# Altium project LNA_pcb.PrjPcb
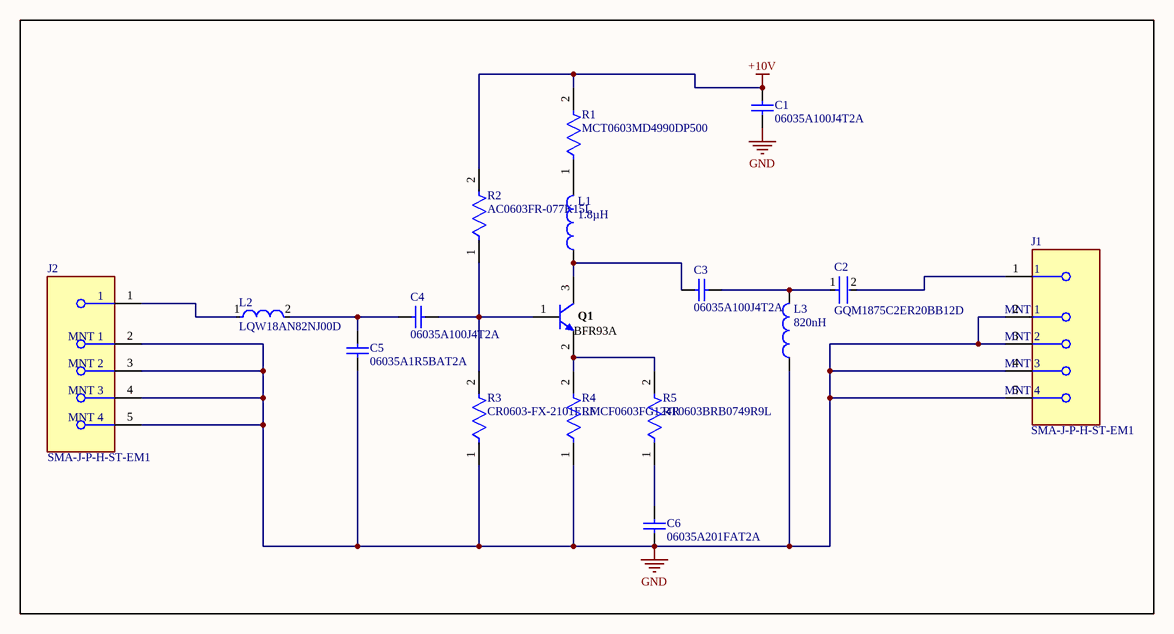
[diagram p0: LNA_sch.SchDoc]
1 sheet, 17 parts. Net scope: global (net labels, ports and power ports of the same name join across sheets).
Board file: pcb_lna.PcbDoc

## Sheet LNA_sch.SchDoc
size A4; SheetNumber: 1; SheetTotal: 1

### Parts
C1  06035A100J4T2A  [CAPC1608X90X35LL15T15]
C2  GQM1875C2ER20BB12D  [FP-GQM187-0_15-IPC_C]
C3  06035A100J4T2A  [CAPC1608X90X35LL15T15]
C4  06035A100J4T2A  [CAPC1608X90X35LL15T15]
C5  06035A1R5BAT2A  [CAPC1608X90X35NL15T15]
C6  06035A201FAT2A  [CAPC1608X90X35LL15T15]
J1  SMA-J-P-H-ST-EM1  [FP-SMA-J-P-H-ST-EM1-MFG]
J2  SMA-J-P-H-ST-EM1  [FP-SMA-J-P-H-ST-EM1-MFG]
L1  value 1.8µH  [INDC2012X60N]  (hidden comment: 0805L)
L2  LQW18AN82NJ00D  [FP-LQW18AN_00-MFG]
L3  value 820nH  [INDC1608X60N]  (hidden comment: 0603_820nL)
Q1  BFR93A  [INF-SOT23_N]
R1  MCT0603MD4990DP500  [FP-MCT0603-IPC_B]
R2  AC0603FR-077K15L  [FP-AC0603-MFG]
R3  CR0603-FX-2101ELF  [FP-CR0603-IPC_C]
R4  RMCF0603FG124R  [FP-RMCF0603-IPC_A]
R5  RT0603BRB0749R9L  [FP-RT0603-MFG]

### Nets
+10V: C1.2 R1.2 R2.2
GND: C1.1 C5.1 C6.1 J1.2(MNT_1) J1.3(MNT_2) J1.4(MNT_3) J1.5(MNT_4) J2.2(MNT_1) J2.3(MNT_2) J2.4(MNT_3) J2.5(MNT_4) L3.1 R3.1 R4.1
NetC2_1: C2.1 C3.1 L3.2
NetC2_2: C2.2 J1.1
NetC3_2: C3.2 L1.1 Q1.3(C)
NetC4_1: C4.1 C5.2 L2.2
NetC4_2: C4.2 Q1.1(B) R2.1 R3.2
NetC6_2: C6.2 R5.1
NetJ2_1: J2.1 L2.1
NetL1_2: L1.2 R1.1
NetQ1_2: Q1.2(E) R4.2 R5.2

### Library data of the parts
C1 C3 C4 = CMP-2006-04574-1: Manufacturer: AVX Interconnect / Elco; Part Number: 06035A100J4T2A
C2 = CMP-06035-025553-1: Ceramic Capacitor 0.2pF ±0.1pF 250VDC C0G 0603 Paper T/R; Voltage Rating: 250V; Max Operating Temperature: 125°C; Package Quantity: 4000; Case Code (Imperial): 0603; Capacitance: 0.2pF; Packaging: Tape and Reel; Length: 1.6mm; Width: 0.031inch; Dielectric: C0G; Mount: Surface Mount; Radiation Hardening: No; Depth: 0.8mm; Min Operating Temperature: -55°C; Case Code (Metric): 1608; Height: 0.7mm; Voltage Rating (DC): 250V; Termination: SMD/SMT; Thickness: 0.031inch; Case/Package: 0603
C5 = CMP-2006-04261-1: Manufacturer: AVX Interconnect / Elco; Part Number: 06035A1R5BAT2A
C6 = CMP-2006-04266-1: Manufacturer: AVX Interconnect / Elco; Part Number: 06035A201FAT2A
J1 J2 = CMP-02754-000006-1: CONN SMA JACK STR 50OHM EDGE MNT; Dielectric Material: PTFE; Center Contact Plating: Gold; Max Frequency: 6GHz; Body Material: Brass; Voltage Rating: 335V; Impedance: 50R; Package Quantity: 1; Case/Package: SMA; Max Operating Temperature: 125°C; Fastening Type: Threaded; Orientation: Straight; Depth: 13.33mm; RoHS Compliant: Yes; Length: 6.35mm; Insulation Material: Polytetrafluoroethylene; Termination: Solder; Min Operating Temperature: -65°C; Housing Color: Gold; Contact Plating: Gold; Contact Material: Copper; Connector Type: SMA; Mount: Edge; Series: SMA; Packaging: Tray; Body Plating: Gold; Radiation Hardening: No
L1 = CMP-006-00021-1: Surface mount 1.8 uH inductor in 0805 package
L2 = CMP-06042-002805-1: Wire Wound RF Inductor 82nH ±5% 250mA 0.6Ω 0603 (1608); Shielding: Unshielded; Test Frequency: 100MHz; DC Resistance (DCR): 600mR; Q Factor: 34; Current: 160mA; Self Resonant Frequency: 2GHz; Core Material: Non-Magnetic; Package Quantity: 4000; Min Operating Temperature: -55°C; Tolerance: 5%; Resistor Type: Wirewound; Case Code (Metric): 1608; Max Operating Temperature: 125°C; Mount: Surface Mount; Height - Seated (Max): 0.039inch; Height: 0.8mm; Termination: SMD/SMT; Military Standard: Not; Lead Free: Lead Free; Case Code (Imperial): 0603; Packaging: Tape and Reel; Current Rating: 250mA; Radiation Hardening: No; Width: 0.031inch; Max DC Current: 250mA; Case/Package: 0603; Weight: 0.000106oz; Inductance: 82nH; Length: 1.6mm; DC Current: 250mA; Depth: 1mm
L3 = CMP-006-00022-1: Surface mount 820nH inductor in 0603 package
Q1 = CMP-1189-00004-1: NPN Silicon RF Transistor, 12 V VCEO, 90 mA IC, 14.5 dB Gmax, SOT23, Green; Manufacturer: Infineon; Ptot (max): 300.0mW; VCEO (max): 12 V; Green: yes; Gmax (typ): 14.5 dB; IC (max): 90 mA; NFmin (typ): 1.5 dB; Group: For low frequencies, e.g. VHF/UHF; Mounting Technology: Surface Mount; PartNumber: BFR93A; ComponentLink3Description: Package Specification; ComponentLink2URL: http://www.infineon.com/dgdl/bfr93a.pdf?folderId=db3a30431400ef68011425b1354605c1&fileId=db3a30431400ef6801142702189806ae&location=en.Products.RF.RF_Transistors_.High_Linearity_Si-_and_SiGe_C-Transistors_for_use_up_to_6_GHz.DATASHEET.bfr93a.pdf; DatasheetVersion: Aug-2012; ComponentLink3URL: http://www.infineon.com/dgdl/SOT23-Package_Overview.pdf?folderId=db3a30431936bc4b0119532290053c66&fileId=db3a30431936bc4b0119533468123c85; ComponentLink1URL: http://www.infineon.com/; PackageDescription: 3-Pin Small Outline Transistor Package, 1.3 x 2.9 mm Body, 0.95 mm Pitch; PackageReference: SOT23; ComponentLink2Description: Datasheet; ComponentLink1Description: Manufacturer URL
R1 = CMP-02407-004071-1: RES SMD 100 OHM 1% 1/8W 0603; Voltage Rating: 75V; Max Power Dissipation: 150mW; Temperature Coefficient: 25ppm/°C; Tolerance: 0.5%; Power Rating: 125mW; Resistance: 499R; Width: 0.85mm; Package Quantity: 1; Height: 0.022inch; Number of Terminations: 2; Min Operating Temperature: -55°C; Features: Automotive AEC-Q200; Packaging: Tape and Reel; Case Code (Imperial): 0603; Composition: Thin Film; Termination: SMD/SMT; Case/Package: 0603; Max Operating Temperature: 175°C; Length: 0.061inch; Weight: 6.7E-05oz; Case Code (Metric): 1608
R2 = CMP-03412-024834-2: RES 7.15KΩ 1.00% 0.1W 0603; Power Rating: 100mW; Voltage Rating: 50V; Temperature Coefficient: 100ppm/°C; Tolerance: 1%; Resistance: 7.15kR; Max Power Dissipation: 100mW; Resistor Type: Thick Film; Height: 0.022inch; Termination: SMD/SMT; Case/Package: 0603; Max Operating Temperature: 155°C; Width: 0.8mm; Case Code (Imperial): 0603; Min Operating Temperature: -55°C; Case Code (Metric): 1608; RoHS Compliant: Yes; Weight: 7.1E-05oz; Number of Terminations: 2; Length: 0.063inch; Packaging: Tape and Reel; Features: Moisture Resistant; Series: AC
R3 = CMP-07231-004603-1: Thick Film Chip Resistors 0603 2.1kΩ 0.1W 1% 100ppm/°C; Power Rating: 100mW; Resistance: 2.1kR; Voltage Rating: 50V; Radiation Hardening: No; Max Operating Temperature: 155°C; Depth: 0.8mm; Number of Terminations: 2; Length: 1.6mm; Contact Plating: Tin; Composition: Thick Film; Max Power Dissipation: 100mW; Termination: SMD/SMT; Case/Package: 0603; Case Code (Metric): 1608; Military Standard: Not; Package Quantity: 5000; Tolerance: 1%; Min Operating Temperature: -55°C; Temperature Coefficient: 100ppm/°C; Packaging: Tape and Reel; Thickness: 457um; Case Code (Imperial): 0603; Features: Moisture Resistant; Mount: Surface Mount; Width: 0.031inch; Height: 0.022inch
R4 = CMP-26527-005953-1: 124Ω ±1% 0.1W 0603 Thick Film Chip Resistor AEC-Q200 compliant; Max Power Dissipation: 100mW; Temperature Coefficient: 100ppm/°C; Resistance: 124R; Height: 0.022inch; Number of Terminations: 2; Package Quantity: 10000; Length: 0.061inch; Width: 0.031inch; Min Operating Temperature: -55°C; Features: Automotive AEC-Q200; Packaging: Tape and Reel; Tolerance: 1%; Case Code (Imperial): 0603; Mount: Surface Mount; Series: RMCF; RoHS Compliant: Yes; Case Code (Metric): 1608; Max Operating Temperature: 155°C; Case/Package: 0603; Resistor Type: Thick Film
R5 = CMP-03412-023636-1: RES SMD 49.9 OHM 0.1% 1/10W 0603; Manufacturer: Yageo; Voltage Rating: 75V; Value: 49.9Ω; Tolerance: 0.001; Power Rating: 0.1W; Temperature Coefficient: 10 ppm/°C; Height: 0.55mm; Automotive: No; Series: RT; RoHS: TRUE; Manufacturer Part Number: RT0603BRB0749R9L; Device Class L3: Chip SMD Resistors; Temperature Range High: +155°C; Device Class L1: Passive Components; Ipc Land Pattern Name: RESC16080X45; Composition: Thin Film; Octopart: https://octopart.com/rt0603brb0749r9l-yageo-71393647; Temperature: -55°C to +155°C; Package: RT0603; ComponentLink2URL: http://www.yageo.com/documents/recent/PYu-RT_1-to-0.01_RoHS_L_9.pdf; ComponentLink2Description: Datasheet; Digikey Description: RES SMD 49.9 OHM 0.1% 1/10W 0603; Temperature Range Low: -55°C; Lead Free: Yes; Device Class L2: Resistors; Footprint Url: http://www.yageo.com/exep/pages/download/literatures/PYu-R_Mount_10.pdf; Category: Res; Resistance: 49.9Ω